# Altium schematic sheet USB.SchDoc: USB
size A4; DocumentNumber: 15; SheetNumber: 8; SheetTotal: 18
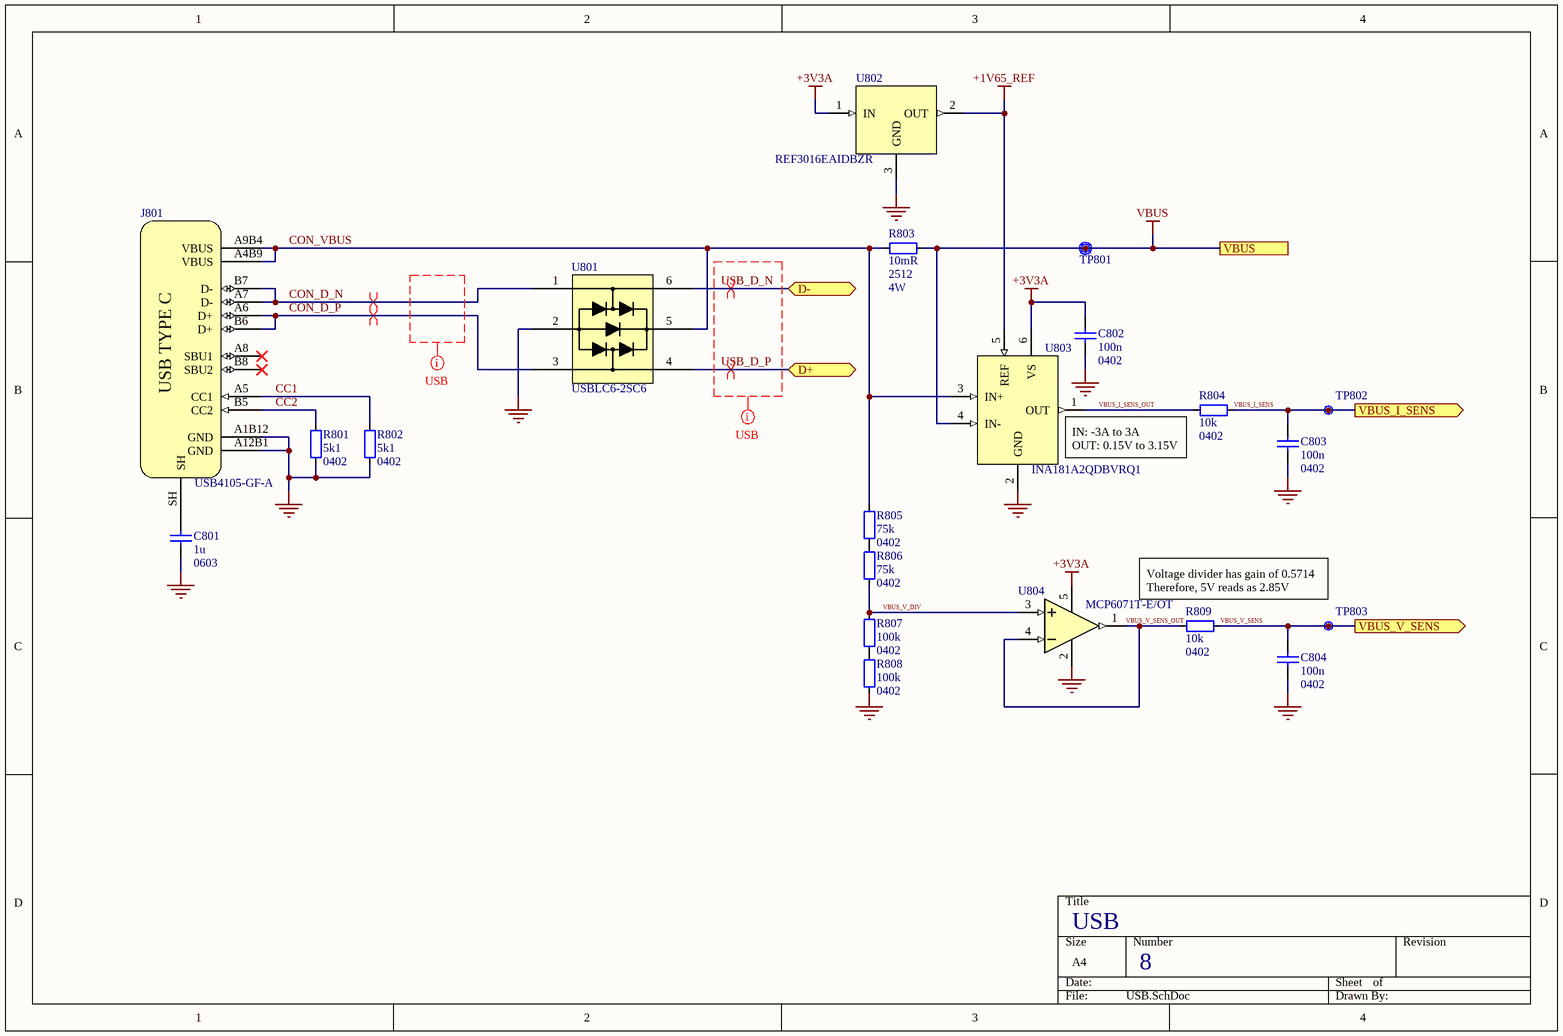
[diagram p0: USB.SchDoc]

## Parts
C801  1u  Footprint: 0603  [CAP_0603_B]
C802  100n  Footprint: 0402  [CAP_0402_B]
C803  100n  Footprint: 0402  [CAP_0402_B]
C804  100n  Footprint: 0402  [CAP_0402_B]
J801  USB4105-GF-A  [USB4105-GF-A]
R801  5k1  Footprint: 0402  [RES_0402_A]
R802  5k1  Footprint: 0402  [RES_0402_A]
R803  10mR  Footprint: 2512  Power: 4W  [VMS-R010-1.0-U]
R804  10k  Footprint: 0402  [RES_0402_A]
R805  75k  Footprint: 0402  [RES_0402_A]
R806  75k  Footprint: 0402  [RES_0402_A]
R807  100k  Footprint: 0402  [RES_0402_A]
R808  100k  Footprint: 0402  [RES_0402_A]
R809  10k  Footprint: 0402  [RES_0402_A]
TP801  Net  [Labelled Testpoint]  (value not drawn)
TP802  Net  [Unlabelled Testpoint]  (value not drawn)
TP803  Net  [Unlabelled Testpoint]  (value not drawn)
U801  USBLC6-2SC6  [USBLC6-2SC6]
U802  REF3016EAIDBZR  [REF3016EAIDBZR]
U803  INA181A2QDBVRQ1  [INA181A2QDBVRQ1]
U804  MCP6071T-E/OT  [MCP6071T-E/OT]

## Ports
D+ (bidir, see Top_Level[3B]), D- (bidir, see Top_Level[3B]), VBUS (see Top_Level[3B], Battery_Charging[1C]), VBUS_I_SENS (out, see Top_Level[3B], Power_Sense[1C]), VBUS_V_SENS (out, see Top_Level[3B], Power_Sense[1C])

## Nets
+1V65_REF: U802.2(OUT) U803.5(REF)
+3V3A: C802.1 U802.1(IN) U803.6(VS) U804.5(VDD)
GND: C801.2 C802.2 C803.2 C804.2 J801.A1B12(GND) J801.A12B1(GND) R801.2(a) R802.2(a) R808.2(a) U801.2(GND) U802.3(GND) U803.2(GND) U804.2(VSS)
VBUS: R803.2(a) TP801.1 U803.4(IN-) ; port VBUS
CC1: J801.A5(CC1) R802.1(a)
CC2: J801.B5(CC2) R801.1(a)
CON_D_N: J801.A7(D-) J801.B7(D-) U801.1(IO1)
CON_D_P: J801.A6(D+) J801.B6(D+) U801.3(IO2)
CON_VBUS: J801.A4B9(VBUS) J801.A9B4(VBUS) R803.1(a) R805.2(a) U801.5(VBUS) U803.3(IN+)
USB_D_N: U801.6(IO1) ; port D-
USB_D_P: U801.4(IO2) ; port D+
VBUS_I_SENS: C803.1 R804.2(a) TP802.1 ; port VBUS_I_SENS
VBUS_I_SENS_OUT: R804.1(a) U803.1(OUT)
VBUS_V_DIV: R806.1(a) R807.1(a) U804.3(VIN+)
VBUS_V_SENS: C804.1 R809.2(a) TP803.1 ; port VBUS_V_SENS
VBUS_V_SENS_OUT: R809.1(a) U804.1(VOUT) U804.4(VIN-)
NetC801_1: C801.1 J801.SH
NetR805_1: R805.1(a) R806.2(a)
NetR807_2: R807.2(a) R808.1(a)

Not connected (* = marked no-connect by the designer): J801 A8(SBU1)* B8(SBU2)*

## Layout directives
differential pair: CON_D_N, CON_D_P, USB_D_N, USB_D_P
net class USB: (no net found under the mark), USB_D_N, USB_D_P

## Notes on the sheet
- (near U803) IN: -3A to 3A
  OUT: 0.15V to 3.15V
- Voltage divider has gain of 0.5714
  Therefore, 5V reads as 2.85V
- (in symbol USB4105-GF-A) USB TYPE C

## Library data of the parts
C801 = CAP_0603: 0603 SMD Capacitor
C802-C804 = CAP_0402: 0402 SMD Capacitor
J801 = USB4105-GF-A: USB-C (USB TYPE-C) USB 2.0 Receptacle Connector 24 (16+8 Dummy) Position Surface Mount, Right Angle; Through Hole; Supplier 1: Future Electronics; Supplier Part Number 1: USB4105-GF-A
R801 R802 R804-R809 = RES_0402: 0402 SMD Resistor
R803 = RES_GENERIC: VMS-R010-1.0-U; Supplier 1: DigiKey; Supplier Part Number 1: 4423-VMS-R010-1.0-UDKR-ND
TP801 = Labelled Testpoint: Symbol for a labelled testpoint
TP802 TP803 = Unlabelled Testpoint: Symbol for an unlabelled testpoint
U801 = USBLC6-2SC6: 17V Clamp 5A (8/20µs) Ipp Tvs Diode Surface Mount SOT-23-6; Supplier 1: Arrow Electronics; Supplier Part Number 1: USBLC6-2SC6
U802 = REF3016EAIDBZR: Series Voltage Reference IC Fixed 1.65V V ±0.1% 25 mA SOT-23-3; Supplier 1: DigiKey; Supplier Part Number 1: 296-REF3016EAIDBZRCT-ND
U803 = INA181A2QDBVRQ1: Current Sense Amplifier 1 Circuit Rail-to-Rail SOT-23-6; Supplier 1: DigiKey; Supplier Part Number 1: 296-INA181A2QDBVRQ1CT-ND
U804 = MCP6071T-E/OT: Standard (General Purpose) Amplifier 1 Circuit Rail-to-Rail SOT-23-5; Supplier 1: Arrow Electronics; Supplier Part Number 1: MCP6071T-E/OT